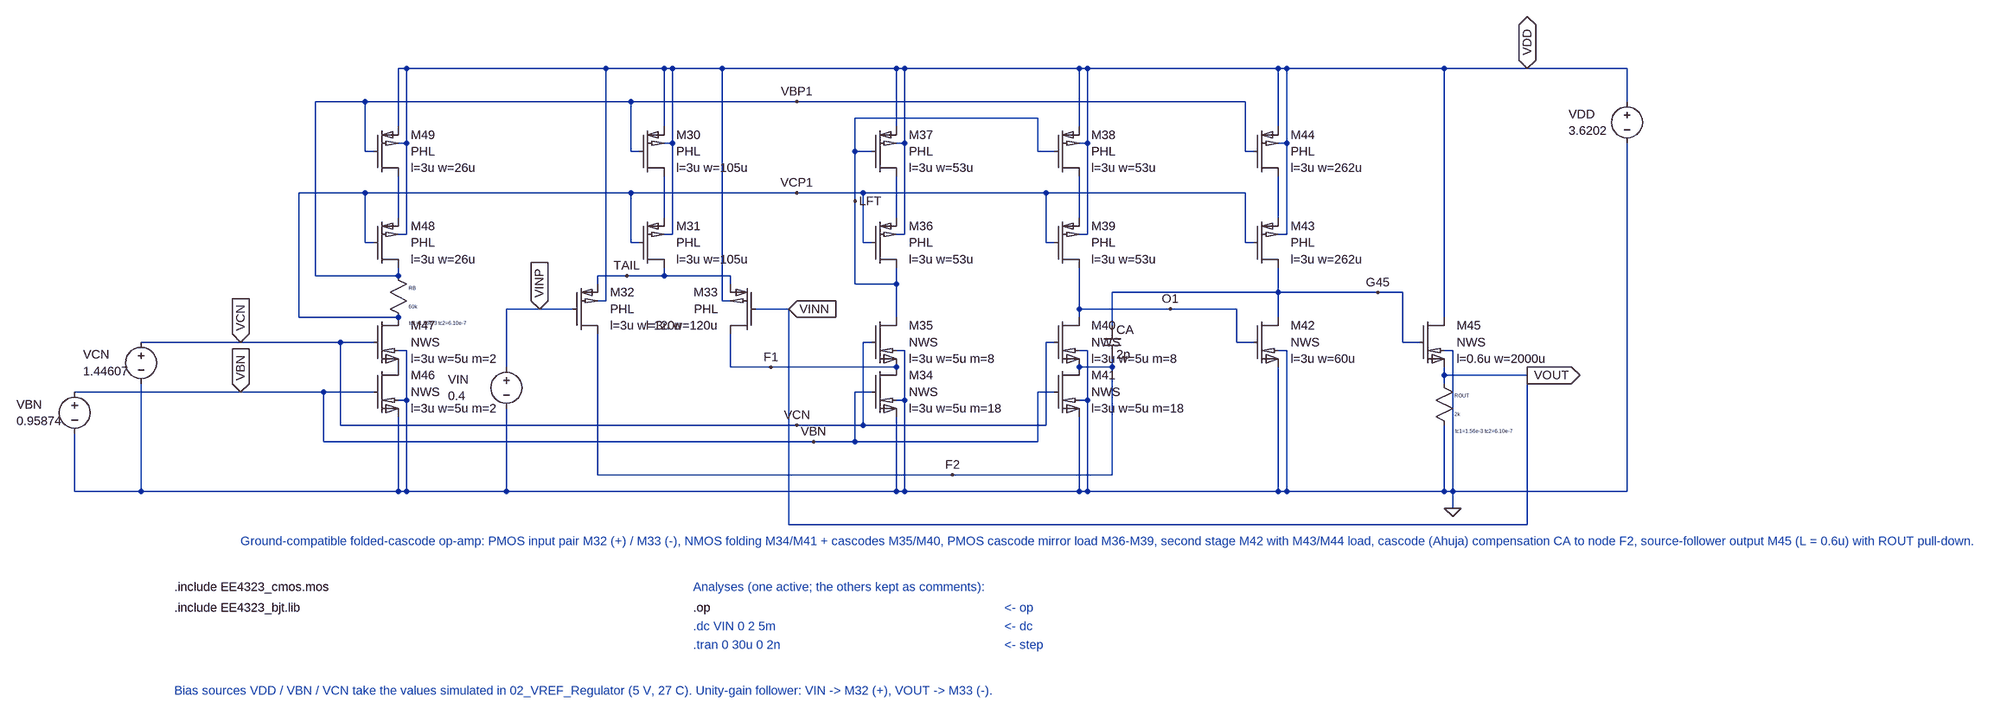
[diagram p0: schematic 03_Folded_Cascode_OpAmp.asc]
03_Folded_Cascode_OpAmp.asc, the LTspice schematic file:
Version 4
SHEET 1 2900 1100
WIRE 432 112 432 0
WIRE 432 208 432 288
WIRE 432 144 448 144
WIRE 448 144 448 0
WIRE 432 320 448 320
WIRE 448 320 448 144
WIRE 384 160 368 160
WIRE 368 160 368 64
WIRE 384 336 368 336
WIRE 368 336 368 240
WIRE 432 384 432 400
WIRE 432 400 272 400
WIRE 272 400 272 64
WIRE 432 480 240 480
WIRE 240 480 240 240
WIRE 432 672 432 816
WIRE 432 544 448 544
WIRE 448 544 448 640
WIRE 432 640 448 640
WIRE 448 640 448 816
WIRE 384 528 320 528
WIRE 320 528 128 528
WIRE 320 528 320 688
WIRE 384 624 288 624
WIRE 288 624 128 624
WIRE 288 624 288 720
WIRE 944 112 944 0
WIRE 944 208 944 288
WIRE 944 144 960 144
WIRE 960 144 960 0
WIRE 944 320 960 320
WIRE 960 320 960 144
WIRE 896 160 880 160
WIRE 880 160 880 64
WIRE 896 336 880 336
WIRE 880 336 880 240
WIRE 944 384 944 400
WIRE 816 400 944 400
WIRE 944 400 1072 400
WIRE 816 400 816 416
WIRE 1072 400 1072 416
WIRE 816 448 832 448
WIRE 832 448 832 0
WIRE 1072 448 1056 448
WIRE 1056 448 1056 0
WIRE 768 464 704 464
WIRE 1120 464 1184 464
WIRE 1392 112 1392 0
WIRE 1392 208 1392 288
WIRE 1392 144 1408 144
WIRE 1408 144 1408 0
WIRE 1392 320 1408 320
WIRE 1408 320 1408 144
WIRE 1344 336 1328 336
WIRE 1328 336 1328 240
WIRE 1744 112 1744 0
WIRE 1744 208 1744 288
WIRE 1744 144 1760 144
WIRE 1760 144 1760 0
WIRE 1744 320 1760 320
WIRE 1760 320 1760 144
WIRE 1696 336 1680 336
WIRE 1680 336 1680 240
WIRE 1392 672 1392 816
WIRE 1392 544 1408 544
WIRE 1408 544 1408 640
WIRE 1392 640 1408 640
WIRE 1408 640 1408 816
WIRE 1344 528 1328 528
WIRE 1328 528 1328 688
WIRE 1344 624 1312 624
WIRE 1312 624 1312 720
WIRE 1744 672 1744 816
WIRE 1744 544 1760 544
WIRE 1760 544 1760 640
WIRE 1744 640 1760 640
WIRE 1760 640 1760 816
WIRE 1696 528 1680 528
WIRE 1680 528 1680 688
WIRE 1696 624 1664 624
WIRE 1664 624 1664 720
WIRE 1392 384 1392 416
WIRE 1392 416 1392 480
WIRE 1392 416 1312 416
WIRE 1312 416 1312 160
WIRE 1312 160 1312 96
WIRE 1312 160 1344 160
WIRE 1312 96 1664 96
WIRE 1664 96 1664 160
WIRE 1664 160 1696 160
WIRE 1744 384 1744 464
WIRE 1744 464 1744 480
WIRE 1072 512 1072 576
WIRE 1072 576 1392 576
WIRE 816 512 816 784
WIRE 816 784 1808 784
WIRE 1808 784 1808 576
WIRE 1808 576 1744 576
WIRE 2128 112 2128 0
WIRE 2128 208 2128 288
WIRE 2128 144 2144 144
WIRE 2144 144 2144 0
WIRE 2128 320 2144 320
WIRE 2144 320 2144 144
WIRE 2080 160 2064 160
WIRE 2064 160 2064 64
WIRE 2080 336 2064 336
WIRE 2064 336 2064 240
WIRE 2128 384 2128 432
WIRE 2128 432 2128 480
WIRE 2128 576 2128 816
WIRE 2128 544 2144 544
WIRE 2144 544 2144 816
WIRE 1744 464 2048 464
WIRE 2048 464 2048 528
WIRE 2048 528 2080 528
WIRE 1808 560 1808 576
WIRE 1808 496 1808 432
WIRE 1808 432 2128 432
WIRE 2128 432 2368 432
WIRE 2368 432 2368 528
WIRE 2368 528 2400 528
WIRE 2448 480 2448 0
WIRE 2448 576 2448 592
WIRE 2448 592 2448 608
WIRE 2448 592 2608 592
WIRE 2448 544 2464 544
WIRE 2464 544 2464 816
WIRE 2448 688 2448 816
WIRE 432 0 448 0
WIRE 448 0 832 0
WIRE 832 0 944 0
WIRE 944 0 960 0
WIRE 960 0 1056 0
WIRE 1056 0 1392 0
WIRE 1392 0 1408 0
WIRE 1408 0 1744 0
WIRE 1744 0 1760 0
WIRE 1760 0 2128 0
WIRE 2128 0 2144 0
WIRE 2144 0 2448 0
WIRE 2448 0 2608 0
WIRE 272 64 368 64
WIRE 368 64 880 64
WIRE 880 64 2064 64
WIRE 240 240 368 240
WIRE 368 240 880 240
WIRE 880 240 1328 240
WIRE 1328 240 1680 240
WIRE 1680 240 2064 240
WIRE 320 688 1328 688
WIRE 1328 688 1680 688
WIRE 288 720 1312 720
WIRE 1312 720 1664 720
WIRE 432 816 448 816
WIRE 448 816 1392 816
WIRE 1392 816 1408 816
WIRE 1408 816 1744 816
WIRE 1744 816 1760 816
WIRE 1760 816 2128 816
WIRE 2128 816 2144 816
WIRE 2144 816 2448 816
WIRE 2448 816 2464 816
WIRE 2464 816 2464 848
WIRE 2800 64 2800 0
WIRE 2800 0 2608 0
WIRE 2800 144 2800 816
WIRE 2800 816 2464 816
WIRE -64 528 128 528
WIRE -64 608 -64 816
WIRE -64 816 432 816
WIRE -192 624 128 624
WIRE -192 704 -192 816
WIRE -192 816 -64 816
WIRE 640 576 640 464
WIRE 640 464 704 464
WIRE 640 656 640 816
WIRE 2608 592 2608 880
WIRE 2608 880 1184 880
WIRE 1184 880 1184 464
FLAG 128 528 VCN
IOPIN 128 528 In
FLAG 128 624 VBN
IOPIN 128 624 In
FLAG 704 464 VINP
IOPIN 704 464 In
FLAG 1184 464 VINN
IOPIN 1184 464 In
FLAG 2608 592 VOUT
IOPIN 2608 592 Out
FLAG 2608 0 VDD
IOPIN 2608 0 BiDir
FLAG 2464 848 0
FLAG 1200 64 VBP1
FLAG 1200 240 VCP1
FLAG 1200 688 VCN
FLAG 1232 720 VBN
FLAG 1312 256 LFT
FLAG 1920 464 O1
FLAG 2320 432 G45
FLAG 1150 576 F1
FLAG 1500 784 F2
FLAG 872 400 TAIL
SYMBOL pmos_PHL 384 112 R0
WINDOW 0 72 16 Left 2
WINDOW 3 72 48 Left 2
WINDOW 123 72 80 Left 2
SYMATTR InstName M49
SYMATTR Value PHL
SYMATTR Value2 l=3u w=26u
SYMBOL pmos_PHL 384 288 R0
WINDOW 0 72 16 Left 2
WINDOW 3 72 48 Left 2
WINDOW 123 72 80 Left 2
SYMATTR InstName M48
SYMATTR Value PHL
SYMATTR Value2 l=3u w=26u
SYMBOL R_ndiff 416 384 R0
SYMATTR InstName RB
SYMATTR Value 60k
SYMATTR Value2 tc1=1.56e-3 tc2=6.10e-7
SYMBOL nmos_NWS 384 480 R0
WINDOW 0 72 16 Left 2
WINDOW 3 72 48 Left 2
WINDOW 123 72 80 Left 2
SYMATTR InstName M47
SYMATTR Value NWS
SYMATTR Value2 l=3u w=5u m=2
SYMBOL nmos_NWS 384 576 R0
WINDOW 0 72 16 Left 2
WINDOW 3 72 48 Left 2
WINDOW 123 72 80 Left 2
SYMATTR InstName M46
SYMATTR Value NWS
SYMATTR Value2 l=3u w=5u m=2
SYMBOL pmos_PHL 896 112 R0
WINDOW 0 72 16 Left 2
WINDOW 3 72 48 Left 2
WINDOW 123 72 80 Left 2
SYMATTR InstName M30
SYMATTR Value PHL
SYMATTR Value2 l=3u w=105u
SYMBOL pmos_PHL 896 288 R0
WINDOW 0 72 16 Left 2
WINDOW 3 72 48 Left 2
WINDOW 123 72 80 Left 2
SYMATTR InstName M31
SYMATTR Value PHL
SYMATTR Value2 l=3u w=105u
SYMBOL pmos_PHL 768 416 R0
WINDOW 0 72 16 Left 2
WINDOW 3 72 48 Left 2
WINDOW 123 72 80 Left 2
SYMATTR InstName M32
SYMATTR Value PHL
SYMATTR Value2 l=3u w=120u
SYMBOL pmos_PHL 1120 416 M0
WINDOW 0 72 16 Left 2
WINDOW 3 72 48 Left 2
WINDOW 123 72 80 Left 2
SYMATTR InstName M33
SYMATTR Value PHL
SYMATTR Value2 l=3u w=120u
SYMBOL pmos_PHL 1344 112 R0
WINDOW 0 72 16 Left 2
WINDOW 3 72 48 Left 2
WINDOW 123 72 80 Left 2
SYMATTR InstName M37
SYMATTR Value PHL
SYMATTR Value2 l=3u w=53u
SYMBOL pmos_PHL 1344 288 R0
WINDOW 0 72 16 Left 2
WINDOW 3 72 48 Left 2
WINDOW 123 72 80 Left 2
SYMATTR InstName M36
SYMATTR Value PHL
SYMATTR Value2 l=3u w=53u
SYMBOL pmos_PHL 1696 112 R0
WINDOW 0 72 16 Left 2
WINDOW 3 72 48 Left 2
WINDOW 123 72 80 Left 2
SYMATTR InstName M38
SYMATTR Value PHL
SYMATTR Value2 l=3u w=53u
SYMBOL pmos_PHL 1696 288 R0
WINDOW 0 72 16 Left 2
WINDOW 3 72 48 Left 2
WINDOW 123 72 80 Left 2
SYMATTR InstName M39
SYMATTR Value PHL
SYMATTR Value2 l=3u w=53u
SYMBOL nmos_NWS 1344 480 R0
WINDOW 0 72 16 Left 2
WINDOW 3 72 48 Left 2
WINDOW 123 72 80 Left 2
SYMATTR InstName M35
SYMATTR Value NWS
SYMATTR Value2 l=3u w=5u m=8
SYMBOL nmos_NWS 1344 576 R0
WINDOW 0 72 16 Left 2
WINDOW 3 72 48 Left 2
WINDOW 123 72 80 Left 2
SYMATTR InstName M34
SYMATTR Value NWS
SYMATTR Value2 l=3u w=5u m=18
SYMBOL nmos_NWS 1696 480 R0
WINDOW 0 72 16 Left 2
WINDOW 3 72 48 Left 2
WINDOW 123 72 80 Left 2
SYMATTR InstName M40
SYMATTR Value NWS
SYMATTR Value2 l=3u w=5u m=8
SYMBOL nmos_NWS 1696 576 R0
WINDOW 0 72 16 Left 2
WINDOW 3 72 48 Left 2
WINDOW 123 72 80 Left 2
SYMATTR InstName M41
SYMATTR Value NWS
SYMATTR Value2 l=3u w=5u m=18
SYMBOL pmos_PHL 2080 112 R0
WINDOW 0 72 16 Left 2
WINDOW 3 72 48 Left 2
WINDOW 123 72 80 Left 2
SYMATTR InstName M44
SYMATTR Value PHL
SYMATTR Value2 l=3u w=262u
SYMBOL pmos_PHL 2080 288 R0
WINDOW 0 72 16 Left 2
WINDOW 3 72 48 Left 2
WINDOW 123 72 80 Left 2
SYMATTR InstName M43
SYMATTR Value PHL
SYMATTR Value2 l=3u w=262u
SYMBOL nmos_NWS 2080 480 R0
WINDOW 0 72 16 Left 2
WINDOW 3 72 48 Left 2
WINDOW 123 72 80 Left 2
SYMATTR InstName M42
SYMATTR Value NWS
SYMATTR Value2 l=3u w=60u
SYMBOL cap 1792 496 R0
SYMATTR InstName CA
SYMATTR Value 2p
SYMBOL nmos_NWS 2400 480 R0
WINDOW 0 72 16 Left 2
WINDOW 3 72 48 Left 2
WINDOW 123 72 80 Left 2
SYMATTR InstName M45
SYMATTR Value NWS
SYMATTR Value2 l=0.6u w=2000u
SYMBOL R_ndiff 2432 592 R0
SYMATTR InstName ROUT
SYMATTR Value 2k
SYMATTR Value2 tc1=1.56e-3 tc2=6.10e-7
SYMBOL voltage 2800 48 R0
WINDOW 0 -112 40 Left 2
WINDOW 3 -112 72 Left 2
SYMATTR InstName VDD
SYMATTR Value 3.6202
SYMBOL voltage -64 512 R0
WINDOW 0 -112 40 Left 2
WINDOW 3 -112 72 Left 2
SYMATTR InstName VCN
SYMATTR Value 1.44607
SYMBOL voltage -192 608 R0
WINDOW 0 -112 40 Left 2
WINDOW 3 -112 72 Left 2
SYMATTR InstName VBN
SYMATTR Value 0.95874
SYMBOL voltage 640 560 R0
WINDOW 0 -112 40 Left 2
WINDOW 3 -112 72 Left 2
SYMATTR InstName VIN
SYMATTR Value 0.4
TEXT 128 912 Left 2 ;Ground-compatible folded-cascode op-amp: PMOS input pair M32 (+) / M33 (-), NMOS folding M34/M41 + cascodes M35/M40, PMOS cascode mirror load M36-M39, second stage M42 with M43/M44 load, cascode (Ahuja) compensation CA to node F2, source-follower output M45 (L = 0.6u) with ROUT pull-down.
TEXT 0 1000 Left 2 !.include EE4323_cmos.mos
TEXT 0 1040 Left 2 !.include EE4323_bjt.lib
TEXT 1000 1000 Left 2 ;Analyses (one active; the others kept as comments):
TEXT 1000 1040 Left 2 !.op
TEXT 1600 1040 Left 2 ;<- op
TEXT 1000 1076 Left 2 ;.dc VIN 0 2 5m
TEXT 1600 1076 Left 2 ;<- dc
TEXT 1000 1112 Left 2 ;.tran 0 30u 0 2n
TEXT 1600 1112 Left 2 ;<- step
TEXT 0 1200 Left 2 ;Bias sources VDD / VBN / VCN take the values simulated in 02_VREF_Regulator (5 V, 27 C). Unity-gain follower: VIN -> M32 (+), VOUT -> M33 (-).

The netlist it stands for:
* 03_Folded_Cascode_OpAmp.asc
M49 N001 VBP1 VDD VDD PHL l=3u w=26u
M48 VBP1 VCP1 N001 VDD PHL l=3u w=26u
RB VBP1 VCP1 60k tc1=1.56e-3 tc2=6.10e-7
M47 VCP1 VCN P001 0 NWS l=3u w=5u m=2
M46 P001 VBN 0 0 NWS l=3u w=5u m=2
M30 N002 VBP1 VDD VDD PHL l=3u w=105u
M31 TAIL VCP1 N002 VDD PHL l=3u w=105u
M32 F2 VINP TAIL VDD PHL l=3u w=120u
M33 F1 VOUT TAIL VDD PHL l=3u w=120u
M37 N003 LFT VDD VDD PHL l=3u w=53u
M36 LFT VCP1 N003 VDD PHL l=3u w=53u
M38 N004 LFT VDD VDD PHL l=3u w=53u
M39 O1 VCP1 N004 VDD PHL l=3u w=53u
M35 LFT VCN F1 0 NWS l=3u w=5u m=8
M34 F1 VBN 0 0 NWS l=3u w=5u m=18
M40 O1 VCN F2 0 NWS l=3u w=5u m=8
M41 F2 VBN 0 0 NWS l=3u w=5u m=18
M44 N005 VBP1 VDD VDD PHL l=3u w=262u
M43 G45 VCP1 N005 VDD PHL l=3u w=262u
M42 G45 O1 0 0 NWS l=3u w=60u
CA G45 F2 2p
M45 VDD G45 VOUT 0 NWS l=0.6u w=2000u
ROUT VOUT 0 2k tc1=1.56e-3 tc2=6.10e-7
VDD VDD 0 3.6202
VCN VCN 0 1.44607
VBN VBN 0 0.95874
VIN VINP 0 0.4
.model NMOS NMOS
.model PMOS PMOS
.lib standard.mos
* Ground-compatible folded-cascode op-amp: PMOS input pair M32 (+) / M33 (-), NMOS folding M34/M41 + cascodes M35/M40, PMOS cascode mirror load M36-M39, second stage M42 with M43/M44 load, cascode (Ahuja) compensation CA to node F2, source-follower output M45 (L = 0.6u) with ROUT pull-down.
.include EE4323_cmos.mos
.include EE4323_bjt.lib
* Analyses (one active; the others kept as comments):
.op
* <- op
* .dc VIN 0 2 5m
* <- dc
* .tran 0 30u 0 2n
* <- step
* Bias sources VDD / VBN / VCN take the values simulated in 02_VREF_Regulator (5 V, 27 C). Unity-gain follower: VIN -> M32 (+), VOUT -> M33 (-).
.backanno
.end